# EasyEDA Pro project 水利智能船.epro, board PCB1
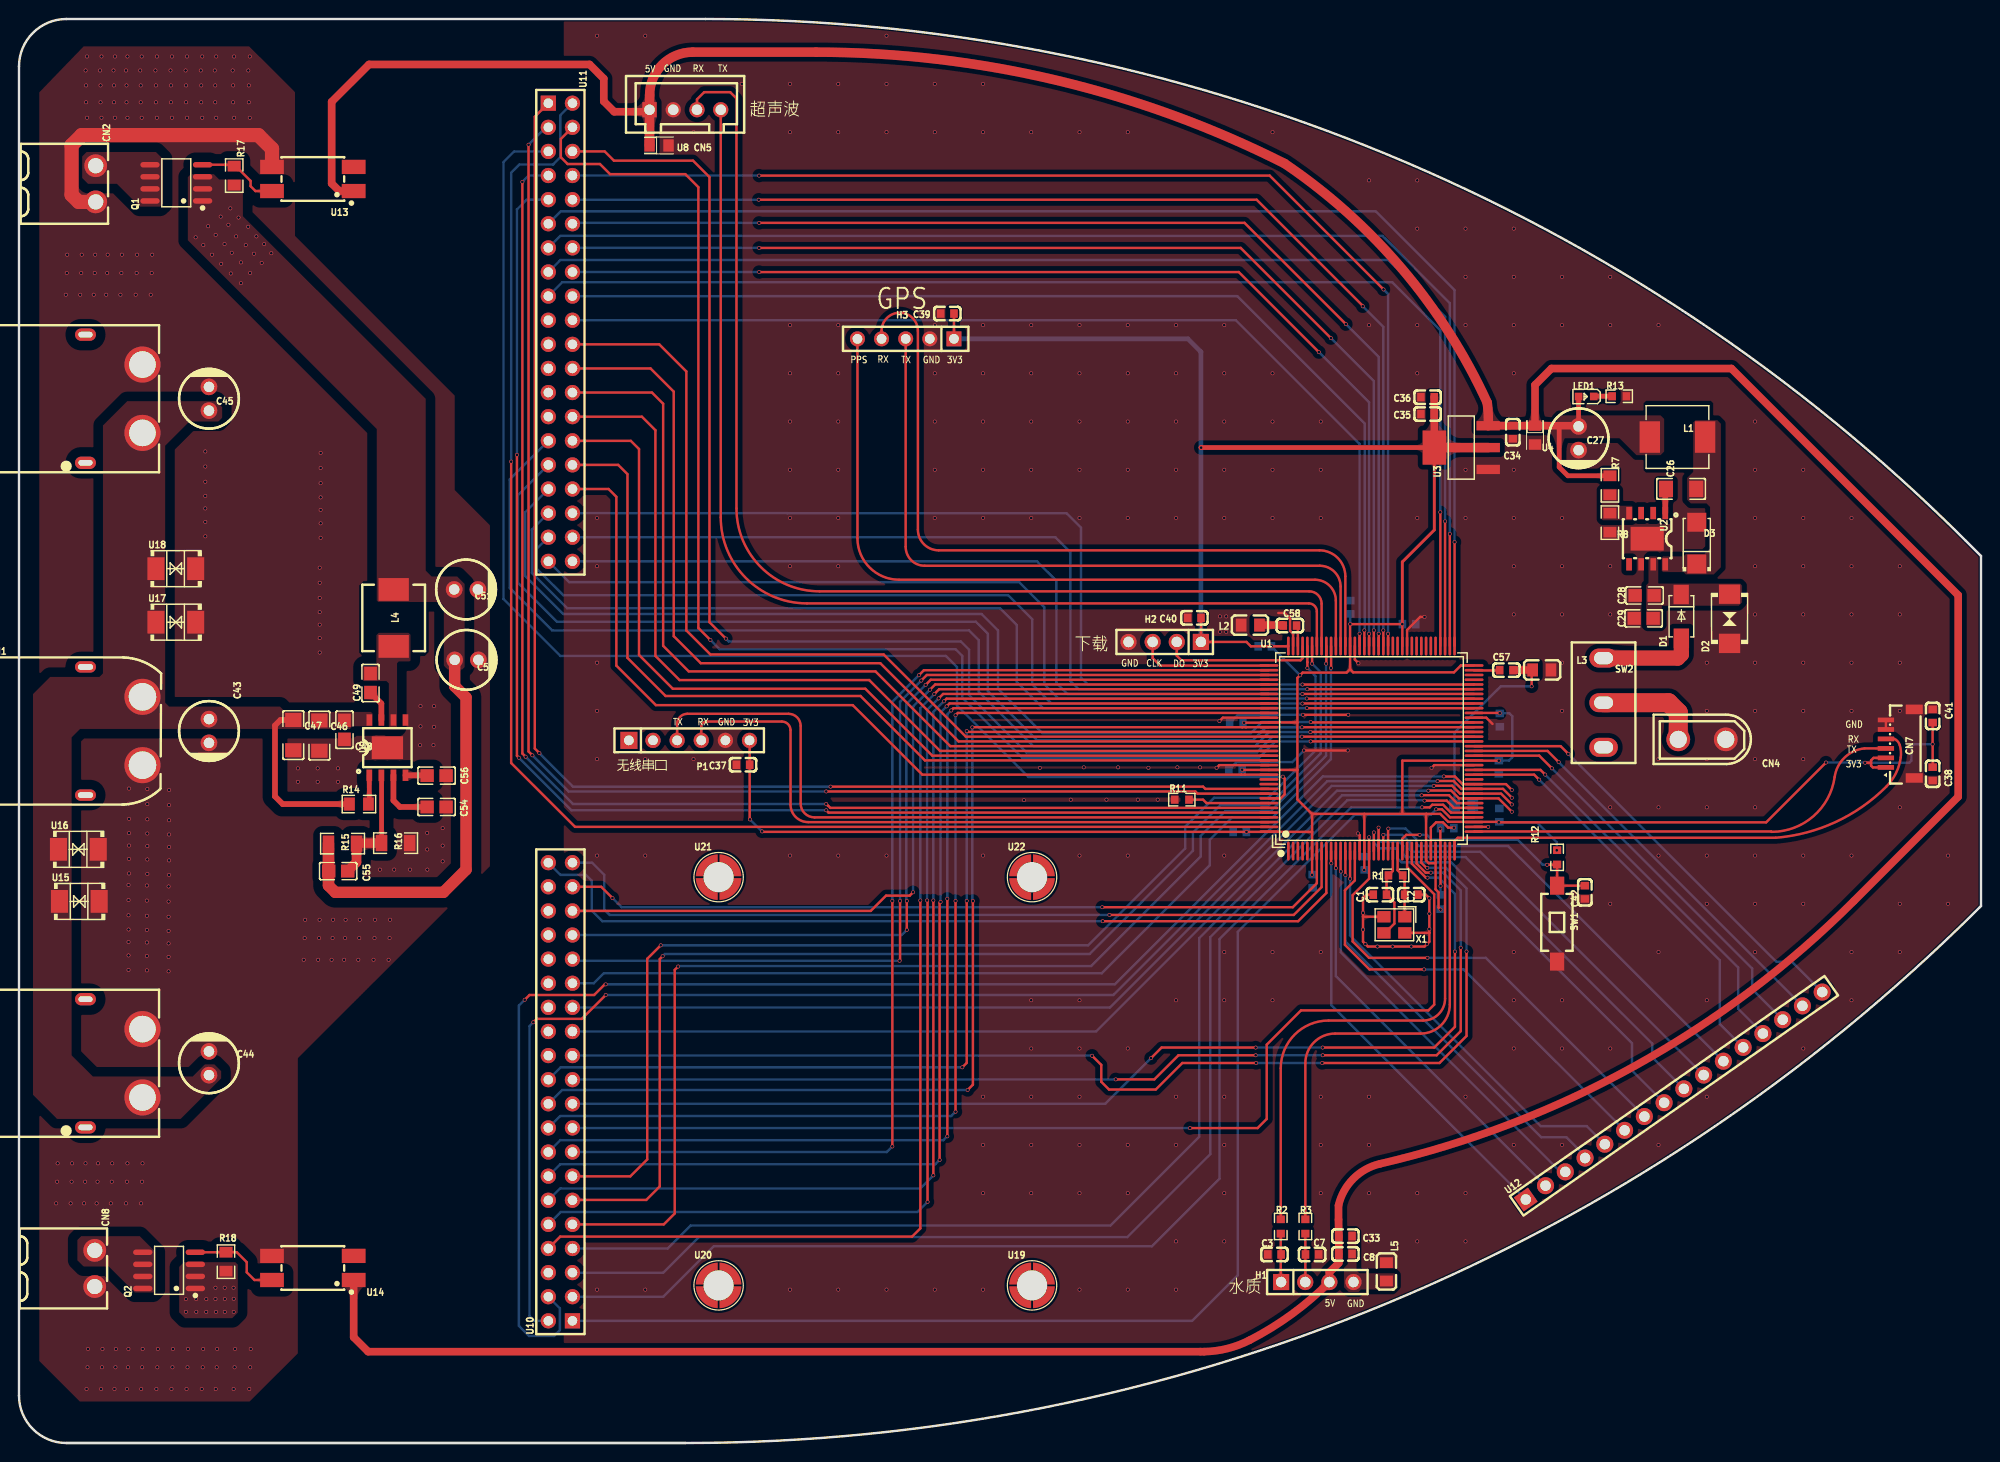
[diagram p1: board, top side]
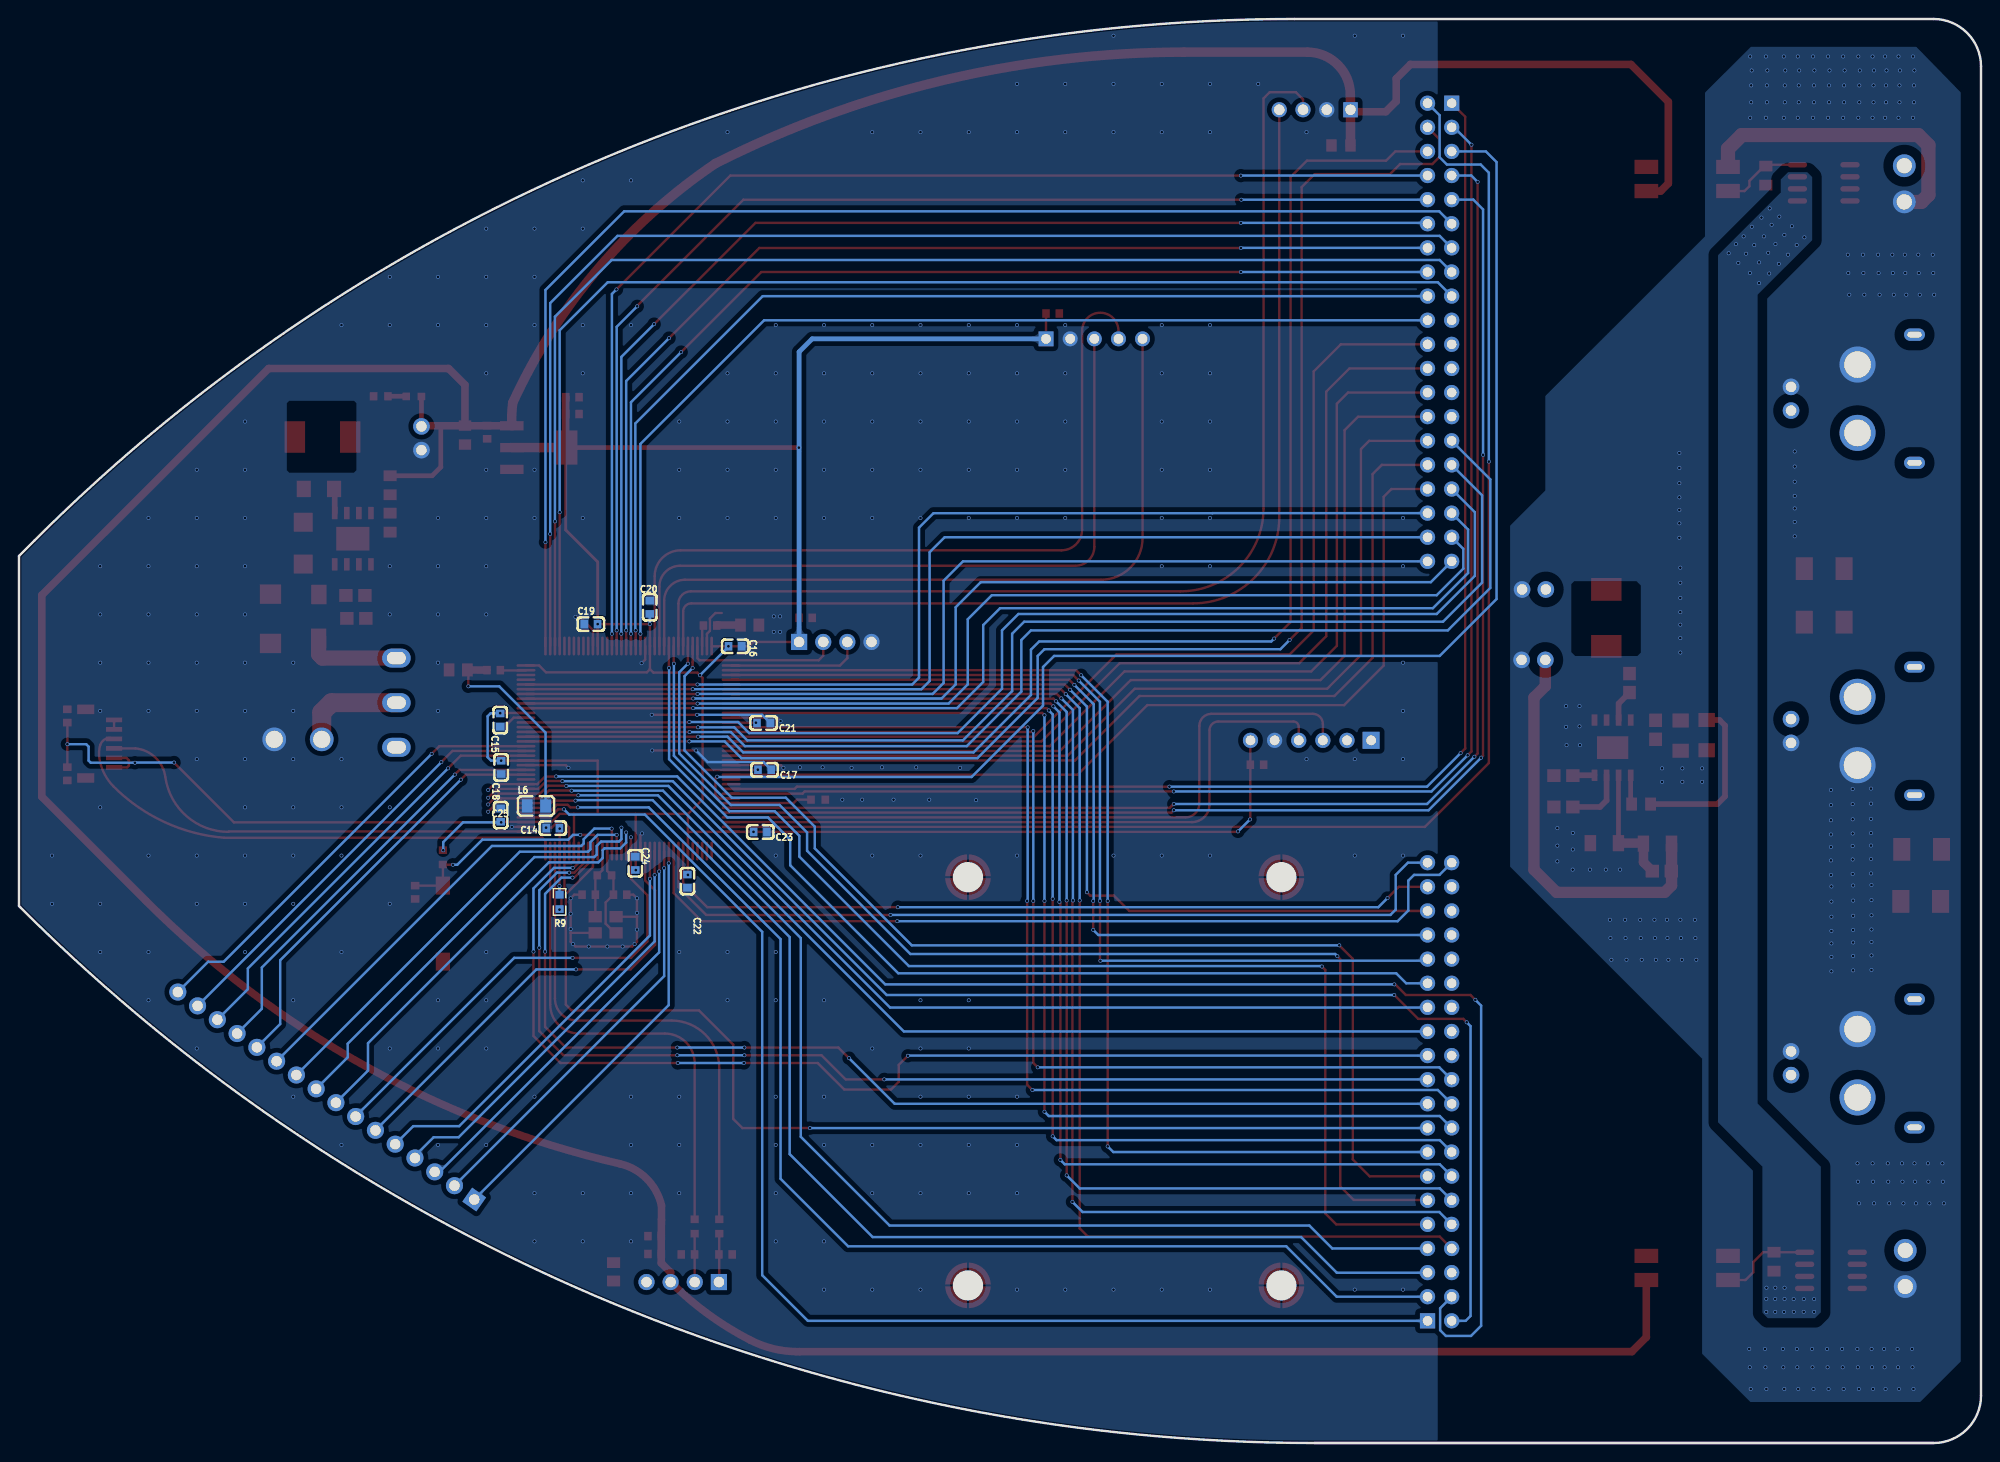
[diagram p2: board, bottom side, seen from below]

Outline 206.57 x 150 mm; copper layers: Top Layer, Bottom Layer. Coordinates in mm from the lower left corner of the outline.
Outline path: 5,0 arc(1.46,1.46) 0,5 0,145 arc(1.46,148.54) 5,150 72.27,150 arc(144.08,135.72) 204.96,95.04 206.57,93.43 206.57,56.57 206.45,56.45 arc(143.92,14.67) 70.16,0 ; 5,0 70.16,0 ; 5,0 70.16,0
Stack: Top Layer 0.035mm / Dielectric1 1.51mm FR4 er 4.5 / Bottom Layer 0.035mm

## Design rules (mm)
template: 自定义配置
spacing copperThickness1oz (default): track to track 0.102, other pairs 0.152 to 0.3
spacing copperThickness2oz: track to track 0.203, other pairs 0.152 to 0.3
track width copperThickness1oz (default): min 0.127, default 0.254, max 2.54
track width copperThickness2oz: min 0.203, default 0.254, max 2.54
differential pair differentialPair (default): width min 0.127, default 0.254, max 2.54; gap min 0.152, default 0.152
via viaSize (default): diameter min 0.3, default 0.4, max 10; hole min 0.3, default 0.3, max 6.3

## Placement (name value [footprint] x y rotation side)
C1  10pF  [C0603]  143.28 57.76 180 top
C2  10pF  [C0603]  146.58 57.76 0 top
C3  100nF  [C0603]  132.18 19.86 180 top
C7  100nF  [C0603]  136.14 19.86 180 top
C8  100nF  [C0603]  139.65 19.91 0 top
C14  100nF  [C0603]  150.37 64.77 180 bottom
C15  100nF  [C0603]  155.91 76.15 90 bottom
C16  100nF  [C0603]  131.17 83.92 0 bottom
C17  100nF  [C0603]  128.07 70.92 0 bottom
C18  100nF  [C0603]  155.8 71.17 90 bottom
C19  100nF  [C0603]  146.35 86.26 180 bottom
C20  100nF  [C0603]  140.16 88.04 270 bottom
C21  100nF  [C0603]  128.17 75.84 0 bottom
C22  100nF  [C0603]  136.19 59.18 90 bottom
C23  100nF  [C0603]  128.52 64.36 0 bottom
C24  100nF  [C0603]  141.68 61.06 90 bottom
C25  100nF  [C0603]  155.85 66.14 90 bottom
C26  10nF  [C1206]  174.99 100.5 0 top
C27  220uF  [CAP-TH_BD6.3-P2.50-D0.6-FD-1]  164.2 105.84 270 top
C28  10uF  [C0805]  171.15 89.28 180 top
C29  4.7uF  [C0805]  171.06 86.87 180 top
C33  10uF  [C0603]  139.65 21.79 0 top
C34  100nF  [C0603]  157.28 106.48 90 top
C35  100nF  [C0603]  148.3 108.38 0 top
C36  10uF  [C0603]  148.3 110.16 0 top
C37  100nF  [C0603]  76.23 71.45 0 top
C38  100nF  [C0603]  201.48 70.49 90 top
C39  100nF  [C0603]  97.74 118.97 180 top
C40  100nF  [C0603]  123.75 86.92 0 top
C41  100nF  [C0603]  201.48 76.59 270 top
C42  100nF  [C0603]  164.86 58.01 90 top
C43  100uF  [CAP-TH_BD6.3-P2.50-D0.6-FD-1]  20 75 270 top
C44  100uF  [CAP-TH_BD6.3-P2.50-D0.6-FD-1]  20 40 90 top
C45  100uF  [CAP-TH_BD6.3-P2.50-D0.6-FD-1]  20 110 90 top
C46  10uF  [C1206]  31.62 74.52 90 top
C47  10uF  [C1206]  28.88 74.57 90 top
C48  100nF  [C0805]  34.27 75.13 90 top
C49  100nF  [C0805]  37.01 80.05 90 top
C51  22uF  [CAP-TH_BD6.3-P2.50-D0.6-FD-1]  47.07 89.91 0 top
C52  22uF  [CAP-TH_BD6.3-P2.50-D0.6-FD-1]  47.12 82.49 0 top
C54  1uF  [C0805]  43.97 67 180 top
C55  100nF  [C0805]  33.61 60.24 0 top
C56  8.2nF  [C0805]  43.97 70.3 180 top
C57  2.2uF  [C0603]  156.59 81.41 0 top
C58  2.2uF  [C0603]  133.81 86.11 180 top
CN1  XT60PW-M  [CONN-TH_XT60PW-M]  10 75 0 top
CN2  3.81-2P  [CONN-TH_2P-P3.81_KF2EDGR-3.81-2P]  8.08 132.64 270 top
CN4  XT30UPB-M  [CONN-TH_XT30UPB-M]  177.2 74.12 180 top
CN5  ZX-XH2.54-4PZZ  [CONN-TH_4P-P2.50_4PIN]  70.13 140.44 0 top
CN7  HC-1.0-6PLT  [CONN-SMD_6P-P1.00_HCTL_HC-1.0-6PLT]  198.05 73.67 90 top
CN8  3.81-2P  [CONN-TH_2P-P3.81_KF2EDGR-3.81-2P]  7.97 18.39 270 top
D1  SS54  [SMA_L4.3-W2.6-LS5.0-FD]  175.01 87.07 90 top
D2  SMBJ28CA  [SMB_L4.3-W3.6-LS5.4-BI]  180.09 86.82 90 top
D3  B340A  [SMA_L4.3-W2.6-LS5.1-RD]  176.64 94.79 90 top
H1  2.54-1*4P母  [HDR-TH_4P-P2.54-V-F]  136.69 16.96 0 top
H2  PZ254V-11-04P  [HDR-TH_4P-P2.54-V-M]  120.62 84.38 180 top
H3  2.54-1*5P母  [HDR-TH_5P-P2.54-V-F]  93.35 116.31 180 top
L1  15uH  [IND-SMD_L7.1-W6.6]  174.61 105.96 180 top
L2  BLM21PG221SN1D  [L0805]  129.64 86.16 0 top
L3  BLM21PG221SN1D  [L0805]  160.32 81.43 180 top
L4  1.5uH  [IND-SMD_L7.0-W6.6]  39.45 86.91 90 top
L5  BLM21PG221SN1D  [L0805]  143.97 18.03 270 top
L6  BLM21PG221SN1D  [L0805]  152.09 67.11 180 bottom
LED1  XL-1608SURC-06  [LED0603-RD_RED]  165 110.24 180 top
P1  2.54-1*6P母  [HDR-TH_6P-P2.54-V-F]  70.56 74.02 0 top
Q1  SI4435DY  [SOP-8_L5.0-W4.0-P1.27-LS6.0-BL]  16.56 132.74 90 top
Q2  SI4435DY  [SOP-8_L5.0-W4.0-P1.27-LS6.0-BL]  15.8 18.19 90 top
R1  1MΩ  [R0603]  144.93 59.79 180 top
R2  10kΩ  [R0603]  132.84 22.81 270 top
R3  10kΩ  [R0603]  135.43 22.81 270 top
R7  10kΩ  [R0805]  167.5 100.88 90 top
R8  3.24kΩ  [R0805]  167.5 96.95 90 top
R9  0Ω  [R0603]  149.66 57 90 bottom
R11  10kΩ  [R0603]  122.43 67.77 180 top
R12  10kΩ  [R0603]  161.94 61.69 90 top
R13  10kΩ  [R0603]  168.48 110.26 180 top
R14  10kΩ  [R0805]  35.79 67.3 0 top
R15  10kΩ  [R1206]  34.06 63.14 0 top
R16  1.5kΩ  [R1206]  39.65 63.19 180 top
R17  10K  [R0805]  22.66 133.5 270 top
R18  10K  [R0805]  21.79 19.1 270 top
SW1  TS-1101-C-W  [SW-SMD_L6.0-W3.3-LS8.0]  161.94 54.71 270 top
SW2  SS-12D10L5  [SW-TH_SS-12D10L5]  166.83 77.98 270 top
U1  STM32F429ZGT6  [LQFP-144_L20.0-W20.0-P0.50-LS22.0-BL]  142.39 73.15 0 top
U2  TPS5430DDAR  [ESOP-8_L4.9-W3.9-P1.27-LS6.0-TL-EP]  171.42 95.26 270 top
U3  AMS1117-3.3V  [SOT-223-4_L6.5-W3.5-P2.30-LS7.0-TR]  151.85 104.85 90 top
U4  10uF  [CAP-SMD_L2.0-W1.3-FD]  159.61 106.17 270 top
U5  XT60PW-F  [TH_2P-XT60PW-F]  10 40 90 top
U7  XT60PW-F  [TH_2P-XT60PW-F]  10 110 90 top
U8  10uF  [CAP-SMD_L2.0-W1.3-FD]  67.39 136.68 0 top
U9  TPS54628DDAR  [ESOP-8_L4.9-W3.9-P1.27-LS6.0-BL-EP]  38.79 73.25 0 top
U10  2.54-2*20  [HDR-TH_40P-P2.54-V-F-R2-C20-S2.54]  57 37 90 top
U11  2.54-2*20  [HDR-TH_40P-P2.54-V-F-R2-C20-S2.54]  57 117 270 top
U12  ZX-PZ2.54-1-16PZZ  [HDR-TH_16P-P2.54-V-M-2]  174.24 36.58 35 top
U13  PC817C  [OPTO-SMD-4_L4.6-W6.5-P2.54-LS10.3-TL]  30.94 133.15 180 top
U14  PC817C  [OPTO-SMD-4_L4.6-W6.5-P2.54-LS10.3-TL]  30.94 18.44 180 top
U15  SMBJ6.5CA  [SMB_L4.6-W3.5-LS5.3-BI]  6.35 57.05 0 top
U16  SMBJ6.5CA  [SMB_L4.6-W3.5-LS5.3-BI]  6.25 62.53 0 top
U17  SMBJ6.5CA  [SMB_L4.6-W3.5-LS5.3-BI]  16.51 86.46 0 top
U18  SMBJ6.5CA  [SMB_L4.6-W3.5-LS5.3-BI]  16.51 92.1 0 top
U19  M3x10+6Cu  [SMD_L4.7-W4.7-D3.0]  106.66 16.6 0 top
U20  M3x10+6Cu  [SMD_L4.7-W4.7-D3.0]  73.66 16.6 0 top
U21  M3x10+6Cu  [SMD_L4.7-W4.7-D3.0]  73.66 59.6 0 top
U22  M3x10+6Cu  [SMD_L4.7-W4.7-D3.0]  106.66 59.6 0 top
X1  32MHz  [CRYSTAL-SMD_4P-L3.2-W2.5-BL]  144.81 54.58 180 top

## Footprints (pads in the part's own frame, mm; a bottom-side part is the same pattern mirrored in y, then rotated)
C0603
  rect 0.8x0.9 smd: 1(-0.7,0) 2(0.7,0)
C0805
  rect 1.41x1.35 smd: 1(-1,0) 2(1,0)
C1206
  rect 1.485x1.728 smd: 1(-1.593,0) 2(1.593,0)
CAP-SMD_L2.0-W1.3-FD
  rect 1.1x1.3 smd: 1(-1,0) 2(1,0)
CAP-TH_BD6.3-P2.50-D0.6-FD-1
  round 1.75 hole 1.1: 1(-1.25,0) 2(1.25,0)
CONN-SMD_6P-P1.00_HCTL_HC-1.0-6PLT
  rect 0.5x1.71 smd: 1(-2.5,1.492) 2(-1.5,1.492) 3(-0.5,1.492) 4(0.5,1.492) 5(1.5,1.492) 6(2.501,1.492)
  rect 1x1.8 smd: 7(3.611,-1.492) 8(-3.611,-1.492)
CONN-TH_2P-P3.81_KF2EDGR-3.81-2P
  round 2.4 hole 1.6: 1(-1.905,0) 2(1.905,0)
CONN-TH_4P-P2.50_4PIN
  rect 1.524x1.6 hole 1.1: 1(-3.75,0)
  round 1.6 hole 1.1: 2(-1.25,0) 3(1.25,0) 4(3.75,0)
CONN-TH_XT30UPB-M
  round 2.5 hole 1.8: 1(-2.5,0) 2(2.5,0)
CONN-TH_XT60PW-M
  round 3.8 hole 2.9: 1(3,-3.6) 2(3,3.6)
  oval 2.2x1.2 hole 1.6x0.6: 3(-3,6.75) 4(-3,-6.75)
CRYSTAL-SMD_4P-L3.2-W2.5-BL
  rect 1.4x1.2 smd: 1(-1.1,-0.85) 2(1.1,-0.85) 3(1.1,0.85) 4(-1.1,0.85)
ESOP-8_L4.9-W3.9-P1.27-LS6.0-BL-EP
  rect 0.6x1.2 smd: 1(-1.905,-2.909) 2(-0.635,-2.909) 3(0.635,-2.909) 4(1.905,-2.909) 5(1.905,2.909) 6(0.635,2.909) 7(-0.635,2.909) 8(-1.905,2.909)
  rect 3.3x2.4 smd: 9(0,0)
ESOP-8_L4.9-W3.9-P1.27-LS6.0-TL-EP
  rect 1.3x0.6 smd: 1(-2.7,1.905) 2(-2.7,0.635) 3(-2.7,-0.635) 4(-2.7,-1.905) 5(2.7,-1.905) 6(2.7,-0.635) 7(2.7,0.635) 8(2.7,1.905)
  rect 2.5x3.5 smd: 9(0,0)
HDR-TH_4P-P2.54-V-F
  rect 1.7x1.7 hole 1.1: 1(-3.81,0)
  round 1.7 hole 1.1: 2(-1.27,0) 3(1.27,0) 4(3.81,0)
HDR-TH_4P-P2.54-V-M
  rect 1.7x1.7 hole 1.1: 1(-3.81,0)
  round 1.7 hole 1.1: 2(-1.27,0) 3(1.27,0) 4(3.81,0)
HDR-TH_5P-P2.54-V-F
  rect 1.575x1.575 hole 1.02: 1(-5.08,0)
  round 1.575 hole 1.02: 2(-2.54,0) 3(0,0) 4(2.54,0) 5(5.08,0)
HDR-TH_6P-P2.54-V-F
  rect 1.8x1.8 hole 1.02: 1(-6.35,0)
  round 1.6 hole 1.02: 2(-3.81,0) 3(-1.27,0) 4(1.27,0) 5(3.81,0) 6(6.35,0)
HDR-TH_16P-P2.54-V-M-2
  rect 1.8x1.8 hole 1.1: 1(-19.05,0)
  round 1.8 hole 1.1: 2(-16.51,0) 3(-13.97,0) 4(-11.43,0) 5(-8.89,0) 6(-6.35,0) 7(-3.81,0) 8(-1.27,0) 9(1.27,0) 10(3.81,0) 11(6.35,0) 12(8.89,0) 13(11.43,0) 14(13.97,0) 15(16.51,0) 16(19.05,0)
HDR-TH_40P-P2.54-V-F-R2-C20-S2.54
  rect 1.6x1.6 hole 1: 1(-24.13,-1.27)
  round 1.6 hole 1: 2(-24.13,1.27) 3(-21.59,-1.27) 4(-21.59,1.27) 5(-19.05,-1.27) 6(-19.05,1.27) 7(-16.51,-1.27) 8(-16.51,1.27) 9(-13.97,-1.27) 10(-13.97,1.27) 11(-11.43,-1.27) 12(-11.43,1.27) 13(-8.89,-1.27) 14(-8.89,1.27) 15(-6.35,-1.27) 16(-6.35,1.27) 17(-3.81,-1.27) 18(-3.81,1.27) 19(-1.27,-1.27) 20(-1.27,1.27) 21(1.27,-1.27) 22(1.27,1.27) 23(3.81,-1.27) 24(3.81,1.27) 25(6.35,-1.27) 26(6.35,1.27) 27(8.89,-1.27) 28(8.89,1.27) 29(11.43,-1.27) 30(11.43,1.27) 31(13.97,-1.27) 32(13.97,1.27) 33(16.51,-1.27) 34(16.51,1.27) 35(19.05,-1.27) 36(19.05,1.27) 37(21.59,-1.27) 38(21.59,1.27) 39(24.13,-1.27) 40(24.13,1.27)
IND-SMD_L7.0-W6.6
  rect 2.4x3.2 smd: 1(-3,0) 2(3,0)
IND-SMD_L7.1-W6.6
  rect 2.15x3.32 smd: 1(-2.913,0) 2(2.913,0)
L0805
  rect 1.133x1.377 smd: 1(-0.966,0) 2(0.966,0)
LED0603-RD_RED
  rect 0.8x0.8 smd: 1(-0.799,-0.004) 2(0.799,0.004)
LQFP-144_L20.0-W20.0-P0.50-LS22.0-BL
  oval 0.28x2 smd: 1(-8.75,-10.8) 2(-8.25,-10.8) 3(-7.75,-10.8) 4(-7.25,-10.8) 5(-6.75,-10.8) 6(-6.25,-10.8) 7(-5.75,-10.8) 8(-5.25,-10.8) 9(-4.75,-10.8) 10(-4.25,-10.8) 11(-3.75,-10.8) 12(-3.25,-10.8) 13(-2.75,-10.8) 14(-2.25,-10.8) 15(-1.75,-10.8) 16(-1.25,-10.8) 17(-0.75,-10.8) 18(-0.25,-10.8) 19(0.25,-10.8) 20(0.75,-10.8) 21(1.25,-10.8) 22(1.75,-10.8) 23(2.25,-10.8) 24(2.75,-10.8) 25(3.25,-10.8) 26(3.75,-10.8) 27(4.25,-10.8) 28(4.75,-10.8) 29(5.25,-10.8) 30(5.75,-10.8) 31(6.25,-10.8) 32(6.75,-10.8) 33(7.25,-10.8) 34(7.75,-10.8) 35(8.25,-10.8) 36(8.75,-10.8) 73(8.75,10.8) 74(8.25,10.8) 75(7.75,10.8) 76(7.25,10.8) 77(6.75,10.8) 78(6.25,10.8) 79(5.75,10.8) 80(5.25,10.8) 81(4.75,10.8) 82(4.25,10.8) 83(3.75,10.8) 84(3.25,10.8) 85(2.75,10.8) 86(2.25,10.8) 87(1.75,10.8) 88(1.25,10.8) 89(0.75,10.8) 90(0.25,10.8) 91(-0.25,10.8) 92(-0.75,10.8) 93(-1.25,10.8) 94(-1.75,10.8) 95(-2.25,10.8) 96(-2.75,10.8) 97(-3.25,10.8) 98(-3.75,10.8) 99(-4.25,10.8) 100(-4.75,10.8) 101(-5.25,10.8) 102(-5.75,10.8) 103(-6.25,10.8) 104(-6.75,10.8) 105(-7.25,10.8) 106(-7.75,10.8) 107(-8.25,10.8) 108(-8.75,10.8)
  oval 2x0.28 smd: 37(10.8,-8.75) 38(10.8,-8.25) 39(10.8,-7.75) 40(10.8,-7.25) 41(10.8,-6.75) 42(10.8,-6.25) 43(10.8,-5.75) 44(10.8,-5.25) 45(10.8,-4.75) 46(10.8,-4.25) 47(10.8,-3.75) 48(10.8,-3.25) 49(10.8,-2.75) 50(10.8,-2.25) 51(10.8,-1.75) 52(10.8,-1.25) 53(10.8,-0.75) 54(10.8,-0.25) 55(10.8,0.25) 56(10.8,0.75) 57(10.8,1.25) 58(10.8,1.75) 59(10.8,2.25) 60(10.8,2.75) 61(10.8,3.25) 62(10.8,3.75) 63(10.8,4.25) 64(10.8,4.75) 65(10.8,5.25) 66(10.8,5.75) 67(10.8,6.25) 68(10.8,6.75) 69(10.8,7.25) 70(10.8,7.75) 71(10.8,8.25) 72(10.8,8.75) 109(-10.8,8.75) 110(-10.8,8.25) 111(-10.8,7.75) 112(-10.8,7.25) 113(-10.8,6.75) 114(-10.8,6.25) 115(-10.8,5.75) 116(-10.8,5.25) 117(-10.8,4.75) 118(-10.8,4.25) 119(-10.8,3.75) 120(-10.8,3.25) 121(-10.8,2.75) 122(-10.8,2.25) 123(-10.8,1.75) 124(-10.8,1.25) 125(-10.8,0.75) 126(-10.8,0.25) 127(-10.8,-0.25) 128(-10.8,-0.75) 129(-10.8,-1.25) 130(-10.8,-1.75) 131(-10.8,-2.25) 132(-10.8,-2.75) 133(-10.8,-3.25) 134(-10.8,-3.75) 135(-10.8,-4.25) 136(-10.8,-4.75) 137(-10.8,-5.25) 138(-10.8,-5.75) 139(-10.8,-6.25) 140(-10.8,-6.75) 141(-10.8,-7.25) 142(-10.8,-7.75) 143(-10.8,-8.25) 144(-10.8,-8.75)
OPTO-SMD-4_L4.6-W6.5-P2.54-LS10.3-TL
  rect 2.5x1.5 smd: 1(-4.3,1.27) 2(-4.3,-1.27) 3(4.3,-1.27) 4(4.3,1.27)
R0603
  rect 0.806x0.864 smd: 1(-0.753,0) 2(0.753,0)
R0805
  rect 1.133x1.377 smd: 1(-1,0) 2(1,0)
R1206
  rect 1.208x1.701 smd: 1(-1.479,0) 2(1.479,0)
SMA_L4.3-W2.6-LS5.0-FD
  rect 2.046x1.62 smd: 1(-2.304,-0.009) 2(2.304,0.009)
SMA_L4.3-W2.6-LS5.1-RD
  rect 2x2 smd: 1(-2.2,0) 2(2.2,0)
SMB_L4.3-W3.6-LS5.4-BI
  rect 2.047x2.241 smd: 1(-2.591,0) 2(2.591,0)
SMB_L4.6-W3.5-LS5.3-BI
  rect 1.8x2.4 smd: 1(-2.091,0) 2(2.091,0)
SMD_L4.7-W4.7-D3.0
  custom 2.3x2.3 smd: 1(-1.25,-1.528) 1(-1.25,1.528) 1(1.25,1.528) 1(1.25,-1.528)
SOP-8_L5.0-W4.0-P1.27-LS6.0-BL
  oval 0.574x2.035 smd: 1(-1.905,-2.768) 2(-0.635,-2.768) 3(0.635,-2.768) 4(1.905,-2.768) 5(1.905,2.768) 6(0.635,2.768) 7(-0.635,2.768) 8(-1.905,2.768)
SOT-223-4_L6.5-W3.5-P2.30-LS7.0-TR
  rect 0.98x2.47 smd: 1(-2.3,-2.835) 2(0,-2.835) 3(2.3,-2.835)
  rect 3.6x2.47 smd: 4(0,2.835)
SW-SMD_L6.0-W3.3-LS8.0
  rect 1.9x1.5 smd: 1(-4,0) 2(4,0)
SW-TH_SS-12D10L5
  oval 2x3 hole 1.3x2: 1(-4.7,0) 2(0,0) 3(4.7,0)
TH_2P-XT60PW-F
  oval 1.3x2.2 hole 0.6x1.5: 1(-6.75,3) 2(6.75,3)
  round 3.8 hole 2.8: 3(-3.6,-3) 4(3.6,-3)

## Nets
As in the schematic.

Pads without a net: CN1 3 4; P1 1 2; SW2 3; U1 48 133 134; U2 2 3 5; U5 1 2; U7 1 2; U10 24 26 28 30 32 34 36; U19 1; U20 1; U21 1; U22 1

## Via types
v1: diameter 0.4, hole 0.3, Top Layer to Bottom Layer, 719 vias
v2: diameter 0.5, hole 0.3, Top Layer to Bottom Layer, 1 via

## Routing (per net, layer and track width the routed paths; a pad name or vN(x,y) marks a point on that pad's centre or on a via; arc(x,y) is an arc through that point)
3V3: length 396.8
  Top Layer w0.254: 140.14,81.52 139.77,81.15 135.15,81.15 v1(134.87,80.87) 134.59,80.59 134.59,75.89 ; 140.14,81.52 U1.95 140.14,86.26 v1(145.64,86.26) 145.64,83.93 ; 140.14,81.52 140.14,81.5 140.46,81.18 151.08,81.18 151.8,81.9 U1.72 ; 149.14,61.07 148.43,61.07 148.14,61.36 U1.30 148.14,66.25 148.17,66.27 ; 149.14,61.07 149.14,58.33 149.45,58.01 149.45,56.39 v1(149.66,56.19) ; 149.14,61.07 149.14,62.33 ; 134.59,75.89 134.58,75.9 U1.121 ; 134.59,75.89 134.59,70.91 ; v1(155.91,76.88) 155.88,76.9 U1.62 ; 196.56,72.17 195.25,72.17 195,71.91 195,71.66 ; 148.17,66.27 149.63,66.27 150.47,65.43 155.75,65.43 v1(155.8,65.38) 183.94,65.38 v1(190.25,71.68) ; 148.17,66.27 145.64,66.27 ; 136.14,66.27 136.14,64.39 ; 136.14,66.27 141.64,66.27 ; 136.14,66.27 136.12,66.27 134.59,67.79 134.59,70.91 ; 136.14,64.39 136.13,64.38 v1(129.24,64.38) 78.28,64.38 v1(78.23,64.42) ; 136.14,64.39 U1.6 v1(136.14,59.84) ; 195,71.66 v1(194.36,71.66) ; 195,71.66 195,71.35 195.18,71.17 196.56,71.17 ; 145.64,66.27 145.64,71.88 v1(155.8,71.88) ; 145.64,66.27 141.64,66.27 ; 131.59,75.88 v1(128.98,75.88) ; 134.59,70.91 134.59,70.9 U1.131 128.8,70.9 v1(128.78,70.93) ; C40.2 124.45,84.39 H2.1 129.23,84.38 129.69,83.92 v1(131.88,83.92) 133.64,83.92 133.64,83.93 ; C41.2 201.47,75.88 v1(201.47,73.61) 201.48,73.6 C38.2 ; C39.1 98.44,116.31 H3.1 ; 141.64,66.27 U1.17 141.64,60.36 v1(141.63,60.35) ; 76.96,74.04 76.93,74.01 C37.2 76.93,65.72 v1(76.96,65.68)
  Top Layer w0.3: v1(145.64,86.26) 145.64,92.81 149.01,96.18 U3.4
  Top Layer w0.5: U3.4 124.46,104.85 v2(124.46,104.85)
  Top Layer w0.8: U3.4 149.01,110.15 C36.2
  Top Layer w1: U3.2 U3.4
  Bottom Layer w0.254: v1(161.9,62.43) 161.9,63.3 159.82,65.38 v1(155.8,65.38) ; v1(134.87,80.87) 131.88,83.87 v1(131.88,83.92) ; v1(155.91,76.88) 156.91,76.88 157.23,76.56 157.23,72.24 156.87,71.88 155.81,71.88 v1(155.8,71.88) ; v1(78.23,64.42) 78.22,64.42 v1(76.96,65.68) ; v1(190.25,71.68) 194.34,71.68 v1(194.36,71.66) 199.01,71.66 199.24,71.88 199.24,73.36 199.49,73.61 v1(201.47,73.61) ; v1(140.16,86.26) C20.2
  Bottom Layer w0.5: H2.1 124.43,114.94 123.06,116.31 H3.1
+5V: length 465.8
  Top Layer w0.5: C27.1 164.2,110.35 ; 162.16,107.09 162.16,102.79 163.07,101.88 R7.2
  Top Layer w0.8: U14.1 35.24,11.14 36.76,9.62 124.38,9.62 arc(124.58,9.62) 124.78,9.62 arc(127.23,9.95) 129.54,10.82 arc(133.99,13.56) H1.3 137.96,17.97 138.95,18.96 C8.1 C33.1 arc(138.93,22.65) 138.92,23.52 138.92,25.02 arc(140.49,27.85) 143.31,29.41 arc(170.19,39.76) 193.19,57.1 204.16,68.07 204.16,89.31 180.29,113.18 161.34,113.18 159.61,111.45 U4.1 ; CN5.1 66.17,140.23 62.66,140.23 61.57,141.33 61.57,143.71 60.07,145.21 36.85,145.21 32.92,141.28 32.92,132.68 33.72,131.88 U13.1 ; U3.3 164.13,107.15 C27.1
  Top Layer w1: U8.1 66.38,136.68 CN5.1 66.4,141.99 arc(67.72,145.18) 70.92,146.51 83.92,146.51 arc(109.27,143.53) 133.25,134.77 arc(145.65,123.64) 154.58,109.58 arc(154.69,108.37) U3.3
AGND: length 29.6
  Top Layer w0.254: v1(151.08,64.82) 150.47,64.82 149.91,65.38 149.2,65.38 148.64,64.82 148.64,62.33 ; L3.2 159.26,81.33 v1(159.26,79.7)
  Top Layer w0.8: L2.2 133.06,86.16 C58.2 ; C57.2 arc(158.33,81.42) L3.2
  Bottom Layer w0.254: L6.2 151.13,74.83 156.01,79.7 v1(159.26,79.7)
GND: length 82.9
  Top Layer w0.254: U1.16 141.14,64.04 v1(140.97,64.21) ; 148.49,53.74 v1(148.49,54.14) v1(148.49,55.76) v1(148.49,57.38) 148.11,57.76 C2.2 ; 148.49,53.74 148.49,52.81 v1(148.24,52.56) 147.98,52.3 v1(146.59,52.3) v1(144.62,52.3) v1(143.02,52.3) 142.01,52.3 v1(141.76,52.55) 141.5,52.81 v1(141.5,54.08) 141.5,55.43 ; 148.49,53.74 148.48,53.73 X1.4 ; X1.2 141.51,55.43 141.5,55.43 ; v1(135.18,76.71) v1(139.95,76.71) ; 155.14,75.74 154.48,76.4 U1.61 ; U1.94 140.64,82.52 v1(141.02,82.14) ; C1.2 141.88,57.76 v1(141.5,57.38) v1(141.5,55.84) 141.5,55.43 ; U1.120 126.74,76.4 v1(126.39,76.05) ; U1.38 v1(154.69,64.9) ; v1(126.09,71.12) 126.37,71.4 128.57,71.4 128.58,71.41 128.98,71.41 128.98,71.4 U1.130 ; v1(148.72,71.12) 149,71.4 U1.51 ; U1.107 134.14,85.23 133.83,85.54 133.83,86.85 133.25,87.43 132.59,87.43 ; CN7.5 CN7.6 ; v1(135.28,72.95) v1(139.9,72.95) ; v1(147.98,87.02) 147.52,87.02 146.14,85.64 U1.83
  Bottom Layer w0.254: v1(135.28,72.95) 134.06,71.73 128.18,71.73 C17.1 ; v1(135.18,76.71) 128.33,76.71 C21.1
  vias: v1(60.86,148.24) v1(60.86,97.44) v1(60.86,92.36) v1(60.86,82.2) v1(60.86,77.12) v1(60.86,72.04) v1(60.86,61.88) v1(60.86,16.16) v1(65.94,148.24) v1(65.94,72.04) v1(65.94,61.88) v1(65.94,16.16) v1(71.02,138.08) v1(71.02,72.04) v1(76.09,143.16) v1(81.18,143.16) v1(81.18,138.08) v1(81.18,117.76) v1(81.18,112.68) v1(81.18,107.6) v1(81.18,102.52) v1(81.18,97.44) v1(81.18,92.36) v1(81.18,61.88) v1(81.18,16.16) v1(86.25,143.16) v1(86.25,138.08) v1(86.25,117.76) v1(86.25,112.68) v1(86.25,107.6) v1(86.25,102.52) v1(86.25,97.44) v1(86.25,92.36) v1(86.25,61.88) v1(86.25,16.16) v1(91.34,148.24) v1(91.34,143.16) v1(91.34,138.08) v1(91.34,61.88) v1(91.34,16.16) v1(96.41,143.16) v1(96.41,138.08) v1(96.41,117.76) v1(96.41,112.68) v1(96.41,107.6) v1(96.41,102.52) v1(96.41,97.44) v1(96.41,16.16) v1(101.5,143.16) v1(101.5,138.08) v1(101.5,117.76) v1(101.5,112.68) v1(101.5,107.6) v1(101.5,102.52) v1(101.5,97.44) v1(101.5,61.88) v1(101.5,36.48) v1(101.5,31.4) v1(101.5,26.32) v1(101.5,16.16) v1(105.81,67.72) v1(106.57,138.08) v1(106.57,117.76) v1(106.57,112.68) v1(106.57,107.6) v1(106.57,102.52) v1(106.57,97.44) v1(106.57,46.64) v1(106.57,41.56) v1(106.57,36.48) v1(106.57,31.4) v1(106.57,26.32) v1(107.48,71.12) v1(110.73,67.77) v1(111.66,138.08) v1(111.66,117.76) v1(111.66,112.68) v1(111.66,107.6) v1(111.66,102.52) v1(111.66,97.44) v1(111.66,61.88) v1(111.66,46.64) v1(111.66,41.56) v1(111.66,36.48) v1(111.66,31.4) v1(111.66,26.32) v1(111.66,16.16) v1(112.11,71.17) v1(114.49,67.77) v1(115.71,71.17) v1(116.74,138.08) v1(116.74,117.76) v1(116.74,112.68) v1(116.74,107.6) v1(116.74,102.52) v1(116.74,97.44) v1(116.74,61.88) v1(116.74,41.56) v1(116.74,31.4) v1(116.74,26.32) v1(116.74,16.16) v1(117.8,67.77) v1(118.91,71.12) v1(119.89,67.77) v1(121.81,117.76) v1(121.81,112.68) v1(121.81,107.6) v1(121.81,102.52) v1(121.81,97.44) v1(121.81,46.64) v1(121.81,36.48) v1(121.81,31.4) v1(121.81,21.24) v1(121.81,16.16) v1(121.96,71.17) v1(124.35,71.17) v1(126.44,87.07) v1(126.44,85.45) v1(126.9,117.76) v1(126.9,112.68) v1(126.9,107.6) v1(126.9,102.52) v1(126.9,97.44) v1(126.9,61.88) v1(126.9,51.72) v1(126.9,46.64) v1(126.9,36.48) v1(126.9,31.4) v1(126.9,26.32) v1(126.9,21.24) v1(127.1,87.07) v1(127.1,85.45) v1(131.97,138.08) v1(131.97,112.68) v1(131.97,107.6) v1(131.97,102.52) v1(131.97,97.44) v1(131.97,51.72) v1(131.97,46.64) v1(137.06,107.6) v1(137.06,102.52) v1(137.06,97.44) v1(137.06,51.72) v1(137.06,36.48) v1(137.06,31.4) v1(137.06,26.32) v1(142.13,133) v1(142.13,117.76) v1(142.13,36.48) v1(142.13,31.4) v1(142.13,26.32) v1(142.13,21.24) v1(147.22,133) v1(147.22,127.92) v1(147.22,117.76) v1(147.22,112.68) v1(147.22,97.44) v1(147.22,26.32) v1(147.22,21.24) v1(152.29,127.92) v1(152.29,122.84) v1(152.29,117.76) v1(152.29,102.52) v1(152.29,97.44) v1(152.29,36.48) v1(152.29,26.32) v1(152.29,21.24) v1(157.38,127.92) v1(157.38,122.84) v1(157.38,117.76) v1(157.38,112.68) v1(157.38,102.52) v1(157.38,97.44) v1(157.38,92.36) v1(157.38,87.28) v1(157.38,51.72) v1(157.38,46.64) v1(157.38,41.56) v1(157.38,31.4) v1(162.46,122.84) v1(162.46,117.76) v1(162.46,97.44) v1(162.46,92.36) v1(162.46,87.28) v1(162.46,82.2) v1(162.46,77.12) v1(162.46,46.64) v1(162.46,41.56) v1(162.46,31.4) v1(167.53,122.84) v1(167.53,117.76) v1(167.53,92.36) v1(167.53,87.28) v1(167.53,66.96) v1(167.53,56.8) v1(167.53,41.56) v1(172.62,117.76) v1(172.62,72.04) v1(172.62,66.96) v1(172.62,61.88) v1(172.62,51.72) v1(172.62,31.4) v1(177.69,82.2) v1(177.69,77.12) v1(177.69,72.04) v1(177.69,66.96) v1(177.69,61.88) v1(177.69,56.8) v1(177.69,46.64) v1(177.69,36.48) v1(182.78,107.6) v1(182.78,102.52) v1(182.78,97.44) v1(182.78,92.36) v1(182.78,87.28) v1(182.78,82.2) v1(182.78,77.12) v1(182.78,72.04) v1(182.78,66.96) v1(182.78,61.88) v1(182.78,56.8) v1(182.78,51.72) v1(187.85,102.52) v1(187.85,97.44) v1(187.85,92.36) v1(187.85,87.28) v1(187.85,82.2) v1(187.85,77.12) v1(187.85,72.04) v1(187.85,61.88) v1(187.85,56.8) v1(187.85,41.56) v1(192.94,97.44) v1(192.94,92.36) v1(192.94,87.28) v1(192.94,82.2) v1(192.94,77.12) v1(192.94,61.88) v1(192.94,51.72) v1(192.94,46.64) v1(198.01,92.36) v1(198.01,87.28) v1(198.01,82.2) v1(198.01,77.12) v1(198.01,66.96) v1(198.01,56.8) v1(198.01,51.72) v1(203.09,61.88) v1(203.09,56.8)
VDDA: length 7
  Top Layer w0.254: v1(149.64,64.72) 149.64,62.33 149.66,62.31 v1(149.66,58.68)
  Bottom Layer w0.254: v1(149.66,58.68) 149.66,57.76 R9.2
AD1_CH1: length 52.9
  Top Layer w0.254: R2.1 132.84,39.47 arc(134.31,43.03) 137.87,44.5 147.83,44.5 arc(149.46,45.18) 150.14,46.81 U1.34
AD1_CH2: length 51.3
  Top Layer w0.254: R3.1 135.43,40 arc(136.35,42.21) 138.56,43.13 147.57,43.13 arc(149.74,44.03) 150.64,46.2 U1.35
BAT_GND: length 32.1
  Top Layer w1.5: U13.3 26.64,136.33 25.2,137.77 6.6,137.77 5.54,136.7 5.54,131.47 6.27,130.73 CN2.2
  vias: v1(3.91,25.24) v1(4.01,27.53) v1(4.06,29.46) v1(4.93,120.95) v1(5.03,123.24) v1(5.08,125.17) v1(5.44,25.24) v1(5.54,27.53) v1(5.59,29.46) v1(6.45,120.95) v1(6.6,125.17) v1(6.55,123.24) v1(6.85,25.24) v1(7.01,144.58) v1(7,29.46) v1(6.95,27.53) v1(7.06,143) v1(7.06,141.22) v1(7.11,5.69) v1(7.16,146.05) v1(7.16,139.6) v1(7.21,7.98) v1(7.26,9.91) v1(7.87,120.95) v1(8.02,125.17) v1(7.97,123.24) v1(8.17,25.24) v1(8.32,29.46) v1(8.27,27.53) v1(8.53,144.58) v1(8.59,143) v1(8.59,141.22) v1(8.64,5.69) v1(8.69,146.05) v1(8.69,139.6) v1(8.74,7.98) v1(8.79,9.91) v1(9.18,120.95) v1(9.34,125.17) v1(9.29,123.24) v1(9.66,25.24) v1(9.82,29.46) v1(9.77,27.53) v1(9.95,144.58) v1(10,143) v1(10,141.22) v1(10.1,146.05) v1(10.1,139.6) v1(10.05,5.69) v1(10.2,9.91) v1(10.15,7.98) v1(10.68,120.95) v1(10.83,125.17) v1(10.78,123.24) v1(11.27,144.58) v1(11.32,143) v1(11.32,141.22) v1(11.27,25.24) v1(11.42,146.05) v1(11.42,139.6) v1(11.42,29.46) v1(11.37,27.53) v1(11.37,5.69) v1(11.53,58.78) v1(11.53,57.19) v1(11.53,55.59) v1(11.53,54.09) v1(11.53,52.78) v1(11.53,51.36) v1(11.53,49.84) v1(11.52,9.91) v1(11.47,7.98) v1(11.58,68.94) v1(11.58,67.35) v1(11.58,65.75) v1(11.58,64.25) v1(11.58,62.94) v1(11.58,61.52) v1(11.58,60) v1(12.28,120.95) v1(12.43,125.17) v1(12.38,123.24) v1(12.76,144.58) v1(12.81,143) v1(12.81,141.22) v1(12.92,146.05) v1(12.92,139.6) v1(12.85,25.24) v1(12.87,5.69) v1(13.01,29.46) v1(12.95,27.53) v1(13.02,9.91) v1(12.97,7.98) v1(13.51,68.89) v1(13.51,67.3) v1(13.51,65.7) v1(13.51,64.2) v1(13.51,62.88) v1(13.51,61.47) v1(13.51,59.94) v1(13.46,58.72) v1(13.46,57.14) v1(13.46,55.54) v1(13.46,54.04) v1(13.46,52.72) v1(13.46,51.31) v1(13.46,49.78) v1(13.87,120.95) v1(14.02,125.17) v1(13.97,123.24) v1(14.36,144.58) v1(14.41,143) v1(14.41,141.22) v1(14.52,146.05) v1(14.52,139.6) v1(14.47,5.69) v1(14.62,9.91) v1(14.57,7.98) v1(15.75,58.62) v1(15.75,57.04) v1(15.75,55.44) v1(15.75,53.94) v1(15.75,52.62) v1(15.75,51.21) v1(15.75,49.68) v1(15.8,68.78) v1(15.8,67.2) v1(15.8,65.6) v1(15.8,64.1) v1(15.8,62.78) v1(15.8,61.37) v1(15.8,59.84) v1(15.95,144.58) v1(16,143) v1(16,141.22) v1(16.1,146.05) v1(16.1,139.6) v1(16.05,5.69) v1(16.2,9.91) v1(16.15,7.98) v1(17.54,144.58) v1(17.59,143) v1(17.59,141.22) v1(17.64,5.69) v1(17.69,146.05) v1(17.69,139.6) v1(17.74,7.98) v1(17.79,9.91) v1(19.14,144.58) v1(19.19,143) v1(19.19,141.22) v1(19.24,5.69) v1(19.29,146.05) v1(19.29,139.6) v1(19.34,7.98) v1(19.39,9.91) v1(19.61,104.44) v1(19.61,102.86) v1(19.61,101.26) v1(19.61,99.76) v1(19.61,98.44) v1(19.61,97.03) v1(19.61,95.5) v1(20.61,144.58) v1(20.66,143) v1(20.66,141.22) v1(20.71,5.69) v1(20.76,146.05) v1(20.76,139.6) v1(20.81,7.98) v1(20.86,9.91) v1(22.49,144.58) v1(22.54,143) v1(22.54,141.22) v1(22.65,146.05) v1(22.65,139.6) v1(22.6,5.69) v1(22.75,9.91) v1(22.7,7.98) v1(24.15,144.58) v1(24.2,143) v1(24.2,141.22) v1(24.25,5.69) v1(24.3,146.05) v1(24.3,139.6) v1(24.35,7.98) v1(24.4,9.91) v1(29.36,71.06) v1(29.36,69.65) v1(29.97,50.9) v1(30.12,55.12) v1(30.07,53.19) v1(31.44,71.06) v1(31.44,69.65) v1(31.5,50.9) v1(31.65,55.12) v1(31.6,53.19) v1(31.66,92.2) v1(31.66,90.62) v1(31.66,89.02) v1(31.66,87.52) v1(31.66,86.2) v1(31.66,84.79) v1(31.66,83.26) v1(31.76,104.29) v1(31.76,102.7) v1(31.76,101.11) v1(31.76,99.61) v1(31.76,98.29) v1(31.76,96.88) v1(31.76,95.35) v1(32.91,50.9) v1(33.01,53.19) v1(33.06,55.12) v1(33.58,71.06) v1(33.58,69.65) v1(34.23,50.9) v1(34.33,53.19) v1(34.38,55.12) v1(35.73,50.9) v1(35.83,53.19) v1(35.88,55.12) v1(37.33,50.9) v1(37.43,53.19) v1(37.48,55.12) v1(38,60.4) v1(38.91,50.9) v1(39.01,53.19) v1(39.06,55.12) v1(39.5,60.4) v1(41.17,60.4) v1(42.22,73.51) v1(42.27,77.62) v1(42.27,75.49) v1(42.98,64.26) v1(42.98,62.52) v1(42.99,60.4) v1(43.64,73.51) v1(43.69,77.62) v1(43.69,75.44) v1(44.6,64.77) v1(44.6,62.93) v1(44.6,61.27)
BAT_IN+: length 17.8
  Top Layer w0.6: C47.2 27.53,76.16 26.95,75.58 26.95,68.11 27.76,67.3 R14.1
GPS_PPS: length 79.9
  Top Layer w0.254: 138.64,83.93 138.64,88.74 arc(138,90.29) 136.45,90.93 92.66,90.93 arc(89.56,92.22) 88.27,95.32 H3.5
PA4: length 138.8
  Top Layer w0.254: U1.40 150.66,65.9 149.81,66.75 v1(149.2,66.75)
  Bottom Layer w0.254: v1(149.2,66.75) 148.64,66.19 140.66,66.19 128.32,53.85 128.32,17.68 123.51,12.87 U10.1
PA5: length 131.5
  Top Layer w0.254: v1(147.73,66.95) 148.52,66.95 148.8,67.23 149.94,67.23 150.77,66.4 U1.41
  Bottom Layer w0.254: v1(147.73,66.95) 140.26,66.95 126.39,53.09 126.39,27.84 119.28,20.73 73.15,20.73 67.84,15.41 U10.3
PA6: length 129.3
  Top Layer w0.254: U1.42 151.08,66.9 150.32,67.67 v1(147.98,67.67)
  Bottom Layer w0.254: v1(147.98,67.67) 147.93,67.72 139.85,67.72 125.43,53.29 125.43,30.43 116.69,21.69 71.58,21.69 67.82,17.93 58.29,17.93 U10.5
PA7: length 127.3
  Top Layer w0.254: U1.43 151.39,67.4 150.56,68.24 147.69,68.24 v1(147.68,68.22)
  Bottom Layer w0.254: U10.7 68.29,20.49 70.71,22.91 114.91,22.91 124.26,32.26 124.26,53.19 139.29,68.22 v1(147.68,68.22)
PA8: length 127.7
  Top Layer w0.254: U1.100 137.64,82.12 v1(137.62,82.09) ; v1(69.39,50.19) 69.04,49.84 69.04,24.18 67.89,23.03 U10.9
  Bottom Layer w0.254: v1(137.62,82.09) 137.62,72.39 131.78,66.55 127,66.55 124.41,63.96 124.41,61.77 112.88,50.24 69.44,50.24 v1(69.39,50.19)
PA11: length 125.1
  Top Layer w0.254: U1.103 v1(136.14,82.09) ; U10.11 58.3,25.6 66.04,25.6 67.46,27.03 67.46,50.97 v1(67.77,51.28)
  Bottom Layer w0.254: v1(136.14,82.09) 137.06,81.18 137.06,72.64 131.62,67.21 126.49,67.21 123.6,64.31 123.6,62.38 112.72,51.51 68,51.51 v1(67.77,51.28)
PA12: length 121.9
  Top Layer w0.254: U1.104 135.64,82.25 135.64,82.25 v1(135.64,81.63) ; v1(67.56,52.43) 66.14,51 66.14,29.87 64.36,28.09 58.29,28.09 U10.13
  Bottom Layer w0.254: v1(67.56,52.43) 112.57,52.43 122.78,62.64 122.78,64.92 125.83,67.97 131.52,67.97 136.5,72.95 136.5,80.78 v1(135.64,81.63)
PA15(JTDI): length 121.8
  Top Layer w0.254: v1(94.74,80.87) 95.27,81.4 U1.110 ; v1(91.95,57.1) v1(91.95,31.24)
  Bottom Layer w0.254: v1(91.95,31.24) 91.36,30.65 U10.15 ; v1(94.74,80.87) 91.95,78.08 v1(91.95,57.1)
PB0: length 147.6
  Top Layer w0.254: v1(61.77,47.19) 59.26,44.68 54.51,44.68 v1(54.15,44.32) ; v1(149.35,69.72) 149.37,69.74 151.04,69.74 151.87,68.9 U1.46 156.24,68.9 v1(157.18,67.97)
  Bottom Layer w0.254: U10.2 54.25,12.87 53.75,13.38 53.75,43.91 v1(54.15,44.32) ; v1(149.35,69.72) 137.74,69.72 115.21,47.19 v1(61.77,47.19)
PB1: length 157.9
  Top Layer w0.254: v1(157.18,68.78) 156.56,69.4 U1.47 151.98,69.4 151.18,70.21 150.02,70.21 v1(150.01,70.21) ; v1(53.24,46.69) 53.75,47.19 60.55,47.19 61.67,48.31 v1(61.77,48.31)
  Bottom Layer w0.254: v1(61.77,48.31) 115.37,48.31 137.27,70.21 v1(150.01,70.21) ; v1(53.24,46.69) 52.63,46.08 52.63,12.34 53.7,11.28 56.34,11.28 56.95,11.89 56.95,14.19 U10.4
PB5: length 147.6
  Top Layer w0.254: U1.135 124.9,68.9 124.66,69.14 v1(85.45,69.14) ; U11.1 54.31,139.7 54.31,73.15 v1(54.79,72.67)
  Bottom Layer w0.254: v1(54.79,72.67) 58.32,69.14 v1(85.45,69.14)
PB6: length 146.5
  Top Layer w0.254: v1(53.65,136.75) 53.65,72.84 v1(54.05,72.44) ; v1(84.99,68.63) 123.85,68.63 124.08,68.4 U1.136
  Bottom Layer w0.254: U11.3 55.48,138.59 v1(53.65,136.75) ; v1(54.05,72.44) 57.86,68.63 v1(84.99,68.63)
PB7: length 147.2
  Top Layer w0.254: U1.137 132.82,67.9 133.25,68.33 133.25,70 v1(133.06,70.19)
  Bottom Layer w0.254: U11.5 52.13,136.05 51,134.93 51,88.9 57,82.91 97.59,82.91 98.75,81.74 98.75,77.67 106.27,70.16 133.03,70.16 v1(133.06,70.19)
PB8: length 144.2
  Top Layer w0.254: v1(53,132.84) 53,72.63 v1(53.34,72.29) ; U1.139 85.41,66.9 85.19,67.13 85.17,67.13 v1(84.99,67.31)
  Bottom Layer w0.254: v1(53,132.84) 53.67,133.51 U11.7 ; v1(84.99,67.31) 58.32,67.31 v1(53.34,72.29)
PB9: length 142.9
  Top Layer w0.254: v1(84.99,66.65) 85.24,66.4 U1.140 ; v1(52.63,72.19) 52.43,72.39 v1(52.43,104.09)
  Bottom Layer w0.254: U11.9 53.45,130.97 52.43,129.95 v1(52.43,104.09) ; v1(52.63,72.19) 58.17,66.65 v1(84.99,66.65)
PB12: length 136.9
  Top Layer w0.254: v1(151.14,94.89) U1.73
  Bottom Layer w0.254: v1(151.14,94.89) 151.14,121.45 142.85,129.74 57.04,129.74 U11.11
PB13: length 134.5
  Top Layer w0.254: v1(150.64,95.76) U1.74
  Bottom Layer w0.254: v1(150.64,95.76) 150.64,120.07 143.56,127.15 56.99,127.15 U11.13
PB14: length 132.1
  Top Layer w0.254: v1(150.14,97.08) U1.75
  Bottom Layer w0.254: U11.15 56.99,124.61 144.17,124.61 150.14,118.64 v1(150.14,97.08)
PB15: length 129.9
  Top Layer w0.254: v1(149.64,98.04) U1.76
  Bottom Layer w0.254: v1(149.64,98.04) 149.64,117.21 144.58,122.27 57.19,122.27 U11.17
PC0: length 118.1
  Top Layer w0.254: v1(123.29,33.17) 130.4,33.17 131.37,34.14 131.37,41.96 134.98,45.57 148.39,45.57 149,46.18 149,57.81 146.14,60.66 U1.26
  Bottom Layer w0.254: U10.17 58.29,33.17 v1(123.29,33.17)
PC1: length 117.5
  Top Layer w0.254: v1(119.18,40.54) 120.29,41.66 v1(130.2,41.66) ; v1(151.18,51.76) 151.18,43.84 149,41.66 v1(137.26,41.66) ; U1.27 146.64,61.03 148.12,59.55 v1(148.29,59.55)
  Bottom Layer w0.254: v1(137.26,41.66) v1(130.2,41.66) ; v1(148.29,59.55) 149.47,59.55 151.18,57.84 v1(151.18,51.76) ; U10.19 114.37,35.73 v1(119.18,40.54)
PC2: length 117.6
  Top Layer w0.254: v1(115.47,38.3) 119.53,38.3 122.07,40.84 v1(130.2,40.84) ; v1(137.26,40.84) 149.25,40.84 151.79,43.38 v1(151.79,52.17) ; U1.28 147.14,61.04 148.1,60.08 v1(148.64,60.08)
  Bottom Layer w0.254: v1(137.26,40.84) v1(130.2,40.84) ; v1(115.47,38.3) 58.3,38.3 U10.21 ; v1(151.79,52.17) 151.79,58.22 149.93,60.08 v1(148.64,60.08)
PC3: length 121.6
  Top Layer w0.254: v1(112.98,40.79) 113.94,39.83 113.94,38.05 114.76,37.24 119.69,37.24 122.48,40.03 v1(130.25,40.03) ; U1.29 147.64,61.12 148.18,60.58 v1(148.27,60.58) ; v1(152.4,51.76) 152.4,42.88 149.56,40.03 v1(137.21,40.03)
  Bottom Layer w0.254: v1(152.4,51.76) 152.4,58.42 150.24,60.58 v1(148.27,60.58) ; v1(137.21,40.03) v1(130.25,40.03) ; v1(112.98,40.79) 112.96,40.81 U10.23
PC4: length 110.3
  Top Layer w0.254: v1(148.39,68.72) 148.4,68.73 150.77,68.73 151.6,67.9 U1.44 155.77,67.9 v1(157.18,66.5)
  Bottom Layer w0.254: v1(148.39,68.72) 138.77,68.72 113.4,43.35 U10.25
PC5: length 109.4
  Top Layer w0.254: v1(157.18,67.26) 156.03,68.4 U1.45 151.71,68.4 150.88,69.24 148.97,69.24 v1(148.95,69.21)
  Bottom Layer w0.254: v1(148.95,69.21) 138.2,69.21 114.86,45.87 58.29,45.87 U10.27
PC9: length 103.1
  Top Layer w0.254: U1.99 138.14,81.65 v1(138.12,81.64)
  Bottom Layer w0.254: v1(138.12,81.64) 138.12,72.03 131.98,65.89 127.71,65.89 125.37,63.55 125.37,60.86 114,49.48 61.57,49.48 60.52,48.43 U10.29
PC10: length 101.8
  Top Layer w0.254: v1(95,80.31) 95.58,80.9 U1.111 ; v1(92.71,50.8) 92.76,50.85 v1(92.76,57.1)
  Bottom Layer w0.254: v1(95,80.31) 92.76,78.08 v1(92.76,57.1) ; v1(92.71,50.8) 58.44,50.8 U10.31
PC11: length 98.5
  Top Layer w0.254: v1(95.45,79.86) 96,80.4 U1.112 ; v1(93.47,57.1) v1(93.47,54.05)
  Bottom Layer w0.254: v1(95.45,79.86) 93.42,77.83 93.42,57.15 v1(93.47,57.1) ; U10.33 92.93,53.51 v1(93.47,54.05)
PC12: length 94.7
  Top Layer w0.254: v1(94.13,58.01) 93.78,57.66 91.29,57.66 89.68,56.05 U10.35 ; U1.113 96.46,79.9 v1(95.91,79.35)
  Bottom Layer w0.254: v1(95.91,79.35) 94.13,77.57 v1(94.13,58.01)
PC13: length 83.7
  Top Layer w0.254: U1.7 136.64,58.97 134.11,56.44 v1(114.05,56.44) ; U10.37 61.3,58.59 v1(62.48,57.4)
  Bottom Layer w0.254: v1(114.05,56.44) 63.45,56.44 v1(62.48,57.4)
PC14-OSC32_IN(PC14): length 88.3
  Top Layer w0.254: v1(114.81,55.63) 134.21,55.63 137.14,58.56 U1.8
  Bottom Layer w0.254: v1(114.81,55.63) 62.18,55.63 61.62,56.19 61.62,59.84 60.33,61.13 U10.39
PC15-OSC32_OUT(PC15): length 92
  Top Layer w0.254: v1(114.1,54.97) 134.67,54.97 137.64,57.94 U1.9
  Bottom Layer w0.254: U10.40 57.02,59.84 59.69,59.84 60.3,59.23 60.3,56.08 61.42,54.97 v1(114.1,54.97)
PD0: length 132.4
  Top Layer w0.254: v1(96.37,78.89) 96.88,79.4 U1.114 ; U10.8 56.98,21.74 94.03,21.74 94.89,22.61 v1(94.89,57.15)
  Bottom Layer w0.254: v1(94.89,57.15) 94.89,77.42 v1(96.37,78.89)
PD1: length 129.4
  Top Layer w0.254: U1.115 97.29,78.9 v1(96.82,78.44) ; v1(95.66,25.4) 95.66,57.1 v1(95.61,57.15)
  Bottom Layer w0.254: v1(96.82,78.44) 95.61,77.22 v1(95.61,57.15) ; v1(95.66,25.4) 94.59,24.33 57.03,24.33 U10.10
PD2: length 126.3
  Top Layer w0.254: v1(96.27,28.19) v1(96.27,57.15) ; v1(97.38,78.13) 97.66,78.4 U1.116
  Bottom Layer w0.254: v1(97.38,78.13) 96.27,77.01 v1(96.27,57.15) ; U10.12 56.98,26.82 94.89,26.82 v1(96.27,28.19)
PD3: length 124
  Top Layer w0.254: v1(97.66,77.6) 97.97,77.9 U1.117 ; v1(96.93,29.82) 96.93,56.9 v1(97.03,57)
  Bottom Layer w0.254: U10.14 56.98,29.36 96.47,29.36 v1(96.93,29.82) ; v1(97.66,77.6) 97.03,76.96 v1(97.03,57)
PD4: length 121.3
  Top Layer w0.254: U1.118 98.38,77.4 v1(98.15,77.17) ; v1(97.74,32.31) v1(97.74,57.33)
  Bottom Layer w0.254: v1(97.74,57.33) 97.74,76.76 v1(98.15,77.17) ; U10.16 56.98,31.9 97.33,31.9 v1(97.74,32.31)
PD5: length 118.4
  Top Layer w0.254: U1.119 98.85,76.9 v1(98.6,76.66) ; v1(98.6,57.1) v1(98.6,34.9)
  Bottom Layer w0.254: v1(98.6,34.9) 98.15,34.44 56.98,34.44 U10.18 ; v1(98.6,76.66) v1(98.6,57.1)
PD6: length 114.4
  Top Layer w0.254: v1(100.43,57.1) 100.43,37.74 v1(99.87,37.19) ; U1.122 129.18,75.4 129.18,75.4 128.78,75.4 128.78,75.4 100.39,75.4 v1(100.37,75.38)
  Bottom Layer w0.254: v1(100.37,75.38) 100.37,57.16 v1(100.43,57.1) ; v1(99.87,37.19) 57.19,37.19 U10.20
PD7: length 111.6
  Top Layer w0.254: v1(99.31,39.57) 99.78,40.04 v1(99.78,57.1) ; v1(99.78,74.99) 99.78,74.92 99.8,74.9 U1.123
  Bottom Layer w0.254: v1(99.78,74.99) v1(99.78,57.1) ; U10.22 57.03,39.57 v1(99.31,39.57)
PDR_ON: length 156.8
  Top Layer w0.254: U1.143 58.54,64.9 51.82,71.63 v1(51.82,103.38)
  Bottom Layer w0.254: U11.2 57,139.86 57,135.43 56.24,134.67 52.68,134.67 51.82,133.81 v1(51.82,103.38)
PE7: length 129.4
  Top Layer w0.254: v1(135.97,74.89) 135.98,74.9 U1.58
  Bottom Layer w0.254: U11.29 51.66,101.5 51.66,90.07 56.13,85.6 100.03,85.6 101.04,84.58 101.04,79.15 106.78,73.41 130.14,73.41 131.62,74.89 v1(135.97,74.89)
PE8: length 125.4
  Top Layer w0.254: U1.59 135.09,75.4 v1(135.08,75.39)
  Bottom Layer w0.254: v1(135.08,75.39) 131.27,75.39 129.9,74.02 107.19,74.02 102.01,79.2 102.01,85.24 100.74,86.51 56.64,86.51 52.53,90.63 52.53,99.83 U11.31
PE9: length 121
  Top Layer w0.254: v1(135.99,75.95) 136.04,75.9 U1.60
  Bottom Layer w0.254: U11.33 53.29,98.05 53.29,91.34 57.3,87.33 101.35,87.33 103.07,85.6 103.07,79.45 107.75,74.78 129.69,74.78 130.86,75.95 v1(135.99,75.95)
PE10: length 115.6
  Top Layer w0.254: v1(135.59,77.41) 135.6,77.4 U1.63
  Bottom Layer w0.254: U11.35 54,96.22 54,91.64 57.71,87.94 103.28,87.94 105.05,86.16 105.05,80.16 107.81,77.41 v1(135.59,77.41)
PE11: length 112.4
  Top Layer w0.254: v1(135.13,77.89) 135.14,77.9 U1.64
  Bottom Layer w0.254: v1(135.13,77.89) 108.7,77.89 106.68,79.91 106.68,86.77 104.14,89.31 57.3,89.31 54.51,92.1 54.51,94.19 U11.37
PE12: length 108.2
  Top Layer w0.254: v1(135.59,78.42) 135.61,78.4 U1.65
  Bottom Layer w0.254: U11.39 57.92,90.68 105.31,90.68 107.95,88.04 107.95,79.91 109.44,78.42 v1(135.59,78.42)
PE13: length 107
  Top Layer w0.254: U1.66 v1(135.13,78.9)
  Bottom Layer w0.254: v1(135.13,78.9) 110.38,78.9 109.22,80.06 109.22,90.83 107.18,92.87 U11.40
PE14: length 109.5
  Top Layer w0.254: U1.67 v1(135.64,79.4)
  Bottom Layer w0.254: U11.38 109.11,95.41 110.69,93.83 110.69,80.26 111.56,79.4 v1(135.64,79.4)
PE15: length 111.7
  Top Layer w0.254: U1.68 153.19,79.9 v1(135.13,79.9)
  Bottom Layer w0.254: U11.36 80.92,97.95 80.92,97.94 110.29,97.94 111.81,96.42 111.81,80.62 112.53,79.9 v1(135.13,79.9)
PF0: length 45.2
  Top Layer w0.254: v1(138.16,61.06) 138.14,61.08 U1.10
  Bottom Layer w0.254: v1(138.16,61.06) 138.16,46.12 U12.1
PF1: length 44.4
  Top Layer w0.254: U1.11 v1(138.64,60.55)
  Bottom Layer w0.254: v1(138.64,60.55) 138.64,49.18 U12.2
PF2: length 43.9
  Top Layer w0.254: v1(139.17,60.2) 139.14,60.23 U1.12
  Bottom Layer w0.254: v1(139.17,60.2) 139.17,51.69 162.29,28.56 U12.3
PF3: length 44.3
  Top Layer w0.254: v1(139.65,59.82) 139.65,62.34 U1.13
  Bottom Layer w0.254: v1(139.65,59.82) 139.65,52.83 160.27,32.21 162.92,32.21 164.88,30.24 164.88,30.02
PF4: length 44.8
  Top Layer w0.254: U1.14 v1(140.14,59.44)
  Bottom Layer w0.254: v1(140.14,59.44) 140.14,53.46 160.22,33.38 165.06,33.38 U12.5
PF5: length 47.8
  Top Layer w0.254: v1(147.93,49.89) 142.19,49.89 139.6,52.48 139.6,58.22 140.64,59.26 U1.15
  Bottom Layer w0.254: U12.6 169.04,32.94 152.09,49.89 v1(147.93,49.89)
PF6: length 50.1
  Top Layer w0.254: v1(148.28,51.1) 142.14,51.1 140.41,52.83 140.41,57.71 142.14,59.44 U1.18 v1(142.14,63.81)
  Bottom Layer w0.254: U12.7 171.12,34.41 154.43,51.1 v1(148.28,51.1)
PF7: length 47.1
  Top Layer w0.254: U1.19 142.65,62.36 v1(142.65,64.31)
  Bottom Layer w0.254: v1(142.65,64.31) 142.65,63.25 143.26,62.64 144.93,62.64 145.11,62.46 145.11,61.62 145.57,61.16 150.77,61.16 169.82,42.11 169.82,39.23 U12.8
PF8: length 48.1
  Top Layer w0.254: U1.20 v1(143.14,64.82)
  Bottom Layer w0.254: v1(143.14,64.82) 143.14,63.61 143.4,63.36 145.28,63.36 145.75,62.89 145.75,61.98 146,61.72 152.3,61.72 171.96,42.06 171.96,40.63 U12.9
PF9: length 46.4
  Top Layer w0.254: U1.21 v1(143.64,64.06)
  Bottom Layer w0.254: v1(143.64,64.06) 145.64,64.06 146.41,63.3 146.41,62.53 146.66,62.28 153.85,62.28 U12.10
PF10: length 48.1
  Top Layer w0.254: v1(144.17,64.72) 144.14,64.69 U1.22
  Bottom Layer w0.254: U12.11 156.77,62.89 147.37,62.89 147.12,63.14 147.12,63.6 146,64.72 v1(144.17,64.72)
PF11: length 44.2
  Top Layer w0.254: U1.49 159.52,70.4 v1(160.05,69.88)
  Bottom Layer w0.254: U12.12 179.07,44.13 179.07,50.85 v1(160.05,69.88)
PF12: length 44.5
  Top Layer w0.254: v1(160.68,70.41) 160.19,70.9 U1.50
  Bottom Layer w0.254: v1(160.68,70.41) 181,50.09 181,45.74 183.61,43.13
PF13: length 45.3
  Top Layer w0.254: U1.53 160.06,72.4 v1(161.39,71.07)
  Bottom Layer w0.254: U12.14 182.47,47.8 182.47,49.99 v1(161.39,71.07)
PF14: length 45.7
  Top Layer w0.254: U1.54 160.93,72.9 v1(162.1,71.73)
  Bottom Layer w0.254: U12.15 162.1,71.71 v1(162.1,71.73)
PF15: length 47.4
  Top Layer w0.254: U1.55 162.31,73.4 v1(163.12,72.59)
  Bottom Layer w0.254: v1(163.12,72.59) 185.01,50.7 186.65,50.7 U12.16
PG0: length 156.5
  Top Layer w0.254: v1(72.8,84.58) 71.53,85.85 71.53,132.28 70.16,133.66 62.23,133.66 61.16,134.72 57.76,134.72 57.05,135.43 57.05,137.37 U11.4 ; U1.56 v1(135.99,73.9)
  Bottom Layer w0.254: v1(135.99,73.9) 132.27,73.9 130.5,72.14 105.66,72.14 99.31,78.49 99.31,82.91 98.6,83.62 73.76,83.62 v1(72.8,84.58)
PG1: length 152.1
  Top Layer w0.254: U1.57 v1(135.07,74.4) ; v1(74.42,84.73) 72.69,86.46 72.69,133.35 70.97,135.08 62.64,135.08 61.66,136.05 U11.6
  Bottom Layer w0.254: v1(74.42,84.73) 74.73,84.43 99.16,84.43 100.03,83.57 100.03,78.79 106.07,72.75 130.32,72.75 131.98,74.4 v1(135.07,74.4)
PG2: length 128.1
  Top Layer w0.254: v1(143.66,121.51) 131.67,133.5 v1(77.93,133.5) ; U1.87 v1(144.14,85.24)
  Bottom Layer w0.254: v1(77.93,133.5) 77.92,133.51 U11.8 ; v1(144.14,85.24) 144.14,121.03 v1(143.66,121.51)
PG3: length 124.6
  Top Layer w0.254: v1(141.48,119.74) 141.48,119.79 130.3,130.96 v1(77.88,130.96) ; U1.88 v1(143.64,85.6)
  Bottom Layer w0.254: v1(143.64,85.6) 143.64,117.57 v1(141.48,119.74) ; v1(77.88,130.96) 58.28,130.96 U11.10
PG4: length 121.2
  Top Layer w0.254: v1(139.7,117.86) 129.03,128.52 v1(77.93,128.52) ; U1.89 143.15,83.96 v1(143.15,85.24)
  Bottom Layer w0.254: v1(77.93,128.52) 58.36,128.52 U11.12 ; v1(143.15,85.24) 143.15,114.4 v1(139.7,117.86)
PG5: length 118.1
  Top Layer w0.254: U1.90 v1(142.64,85.6) ; v1(77.93,125.88) 128.63,125.88 v1(138.12,116.38)
  Bottom Layer w0.254: v1(138.12,116.38) 142.64,111.87 v1(142.64,85.6) ; v1(77.93,125.88) 77.92,125.89 U11.14
PG6: length 115.2
  Top Layer w0.254: U1.91 142.14,85.24 v1(142.14,85.24) ; v1(136.85,114.91) 128.42,123.34 v1(77.93,123.34)
  Bottom Layer w0.254: v1(142.14,85.24) 142.14,109.63 v1(136.85,114.91) ; U11.16 77.92,123.35 v1(77.93,123.34)
PG7: length 112.4
  Top Layer w0.254: U1.92 v1(141.64,85.6)
  Bottom Layer w0.254: U11.18 58.28,120.8 128.27,120.8 141.68,107.39 141.68,85.64 v1(141.64,85.6)
PG8: length 109.6
  Top Layer w0.254: U1.93 v1(141.14,85.24)
  Bottom Layer w0.254: U11.20 58.28,118.26 128.12,118.26 141.14,105.24 v1(141.14,85.24)
PG9: length 106.4
  Top Layer w0.254: U11.22 67.4,115.73 70.26,112.88 70.26,85.6 72.8,83.06 91.03,83.06 99.69,74.4 U1.124
PG10: length 104.7
  Top Layer w0.254: U11.24 66.49,113.19 68.94,110.74 68.94,84.99 71.78,82.14 90.68,82.14 98.92,73.9 U1.125
PG11: length 103.7
  Top Layer w0.254: U1.126 98.05,73.4 90.17,81.28 70.51,81.28 67.82,83.97 67.82,109.47 66.64,110.65 U11.26
PG12: length 101.8
  Top Layer w0.254: U11.28 58.28,108.1 65.58,108.1 67,106.68 67,82.91 69.55,80.37 89.51,80.37 96.97,72.9 U1.127
PG13: length 99.8
  Top Layer w0.254: U11.30 58.28,105.56 64.41,105.56 65.28,104.7 65.28,83.01 68.83,79.45 89.1,79.45 96.15,72.4 U1.128
PG14: length 97.6
  Top Layer w0.254: U11.32 63.09,103.03 64.06,102.06 64.06,82.7 68.07,78.69 88.59,78.69 95.38,71.9 U1.129
PG15: length 96.2
  Top Layer w0.254: U11.34 62.07,100.49 62.89,99.67 62.89,81.89 67.06,77.72 87.78,77.72 95.1,70.4 128.68,70.4 128.68,70.4 129.08,70.4 129.08,70.4 U1.132
PLASM_OUT: length 42.8
  Top Layer w1.2: C52.1 45.87,79.73 47.07,78.53 47.07,60.39 44.68,58.01 33.3,58.01 32.58,58.72 R15.1
  vias: v1(17.57,15.16) v1(17.57,13.82) v1(18.59,127) v1(18.66,15.16) v1(18.67,13.82) v1(19.41,126.19) v1(19.72,15.16) v1(19.71,13.82) v1(19.91,128.17) v1(20.32,125.17) v1(20.7,127.25) v1(20.69,16.36) v1(20.69,15.17) v1(20.74,13.81) v1(21.23,129.18) v1(21.28,124.21) v1(21.64,126.29) v1(21.66,16.36) v1(21.67,15.17) v1(21.67,13.81) v1(22.05,128.32) v1(22.25,130.05) v1(22.3,123.19) v1(22.4,125.37) v1(22.59,16.36) v1(22.61,15.19) v1(22.61,13.81) v1(22.86,127.1) v1(23.11,129.08) v1(23.37,124.36) v1(23.37,122.17) v1(23.88,126.19) v1(24.13,128.12) v1(24.33,123.24) v1(24.74,125.27) v1(24.99,127.1) v1(25.55,124.31) v1(25.81,126.29) v1(26.57,125.32)
RESET: length 24.2
  Top Layer w0.254: U1.25 145.64,63.65 146.05,64.06 v1(147.47,64.06) ; C42.2 164.86,58.71 SW1.1 R12.1 161.91,60.91 v1(160.88,60.91)
  Bottom Layer w0.254: v1(160.88,60.91) 160.43,60.91 157.78,63.55 148.74,63.55 148.23,64.06 v1(147.47,64.06)
RX_C: length 120.8
  Top Layer w0.254: CN5.3 71.38,141.54 72.14,142.29 74.88,142.29 75.54,141.63 75.54,98.45 arc(78.1,92.27) 84.28,89.71 135.84,89.71 arc(136.76,89.33) 137.14,88.41 137.14,83.93
RX_GPS: length 83
  Top Layer w0.254: 139.64,83.93 139.64,91.29 arc(138.84,93.23) 136.91,94.03 96.82,94.03 arc(95.28,94.67) 94.64,96.22 94.64,117.15 arc(92.73,119.06) 90.81,117.15 H3.4
RX_HC14: length 70.9
  Top Layer w0.254: P1.4 71.83,75.44 arc(71.99,75.83) 72.39,76 80.31,76 arc(80.96,75.73) 81.23,75.08 81.23,67.26 arc(81.77,65.95) 83.09,65.4 U1.142
RX_TOF: length 54.8
  Top Layer w0.254: 151.14,62.33 151.14,63.41 151.49,63.75 184.96,63.75 arc(191.26,65.41) 196.6,69.14 arc(197.61,70.56) 198.12,72.24 arc(198.14,72.88) 198.02,73.51 arc(197.44,74.17) 196.56,74.17
SWCLK: length 14.3
  Top Layer w0.254: 131.58,81.89 120.14,81.89 119.35,82.68 H2.3
SWDIO: length 16.2
  Top Layer w0.254: H2.2 121.89,82.93 122.38,82.45 134.93,82.45 135.14,82.67 135.14,83.93
TX_C: length 115
  Top Layer w0.254: 136.64,83.93 136.64,87.59 arc(136.39,88.19) 135.79,88.44 82.96,88.44 arc(76.54,91.1) 73.88,97.52 CN5.4
TX_GPS: length 76.4
  Top Layer w0.254: 139.14,83.93 139.14,90.22 arc(138.5,91.76) 136.96,92.41 95.35,92.41 arc(93.94,92.99) 93.35,94.4 H3.3
TX_HC14: length 74.4
  Top Layer w0.254: P1.3 69.29,75.74 arc(69.6,76.5) 70.36,76.81 81.03,76.81 arc(81.92,76.44) 82.3,75.54 82.3,67.36 arc(82.72,66.33) 83.75,65.9 U1.141
TX_TOF: length 47.9
  Top Layer w0.254: 196.56,73.17 194.31,73.17 arc(192.21,72.21) 191.16,70.16 arc(188.92,66.02) 184.52,64.38 184.48,64.42 153.23,64.42 153.19,64.38
$1N1342: length 9.6
  Top Layer w0.254: 144.64,62.33 144.64,60.26 144.18,59.8 R1.2 143.98,59.59 C1.1 144.81,56.94 144.81,54.71 143.83,53.74 143.83,53.73
$1N1938: length 5.1
  Top Layer w0.254: H1.2 135.43,16.97 R3.2
$1N3661: length 5.1
  Top Layer w0.254: R2.2 132.84,17 H1.1
$1N5258: length 2.6
  Top Layer w0.6: C26.1 173.32,100.43 U2.1
$1N11253: length 8.6
  Top Layer w0.254: R11.1 124.66,67.77 125.02,67.41 131.58,67.41 U1.138
$1N11810: length 7.3
  Top Layer w0.254: 146.03,55.43 145.88,55.58 C2.1 145.88,59.59 R1.1 145.14,60.33 145.14,62.33
$1N11862: length 1.9
  Top Layer w0.5: R13.2 167.72,110.26 165.88,110.26
$1N14606: length 3.1
  Top Layer w0.5: U9.1 36.88,67.45 36.74,67.3
$1N14818: length 3.4
  Top Layer w0.6: U9.7 38.15,77.89 37.01,79.04 C49.1
$1N15032: length 2.3
  Top Layer w0.6: U9.4 42.93,70.34 C56.2
$1N15135: length 6.5
  Top Layer w0.6: C54.2 40.11,67 39.42,67.68 U9.3
$1N15320: length 13.1
  Top Layer w0.5: U9.2 38.17,70.32 R16.2
  Top Layer w1: R15.2 35.59,63.19 R16.2 ; C55.2 35.54,61.17 35.54,63.13
$1N18281: length 11.1
  Top Layer w2: SW2.2 173.66,77.98 174.7,76.95 CN4.2
$1N18286: length 10
  Top Layer w1.6: SW2.1 174.63,82.68 175.02,83.07 175.02,84.77
$1N24306: length 2.7
  Top Layer w0.254: 153.19,81.38 155.86,81.38 C57.1
$1N24342: length 2.1
  Top Layer w0.254: 134.64,83.93 134.64,85.99 134.62,86.02
$1N25576: length 8.8
  Top Layer w0.254: 19.33,134.65 22.51,134.65 R17.1 22.83,134.5 24.38,132.94 24.38,132.38 24.89,131.88 U13.4
$1N25775: length 9.9
  Top Layer w0.254: 18.57,20.09 21.78,20.09 R18.1 22.93,20.1 23.98,19.05 23.98,17.98 24.79,17.17 U14.4

## Copper pours and planes (outline as drawn; the poured copper is in the pictures)
+5V on Top Layer: 161.91,108.25 173.21,108.25 173.21,104.06 161.91,104.06
AGND on Top Layer: 139.5,22.35 144.98,22.35 144.98,15.9 139.5,15.9
AGND on Bottom Layer: 150.47,67.98 151.74,67.98 151.74,64.25 150.47,64.25
GND on Top Layer: 57.35,160.88 215.65,160.88 215.65,-5.13 57.35,-5.13
GND on Bottom Layer: 57.2,160.73 215.49,160.73 215.49,-5.28 57.2,-5.28
VCC on Top Layer: 171.3,93.39 181.41,93.39 181.41,86.03 171.3,86.03
BAT_GND on Top Layer: 2.13,142.27 6.81,147.12 24.23,147.12 29.06,142.29 29.06,127.15 45.87,110.34 45.87,100.38 49.58,96.67 49.58,60.76 29.36,40.54 29.36,9.45 24.28,4.37 6.4,4.37 2.13,8.64
BAT_GND on Bottom Layer: 2.13,142.27 6.81,147.07 24.23,147.07 29.06,142.24 29.06,127.1 45.87,110.29 45.87,100.33 49.58,96.62 49.58,60.71 29.36,40.49 29.36,9.4 24.28,4.32 6.4,4.32 2.13,8.59
BAT_IN+ on Top Layer: 1.47,109.74 37.23,109.74 37.23,34.14 1.47,34.14
PLASM_OUT on Top Layer: 17.78,133.66 46.91,133.66 46.91,81.48 17.78,81.48
PLASM_OUT on Top Layer: 16.86,19.05 23.04,19.05 23.04,13.16 16.86,13.16
PLASM_OUT on Bottom Layer: 16.86,133.86 27.69,133.86 27.69,13.16 16.86,13.16
VOUT1 on Top Layer: 6.66,135.99 15.14,135.99 15.14,130.23 6.66,130.23
VOUT2 on Top Layer: 6.15,21.79 14.38,21.79 14.38,15.85 6.15,15.85
$1N5263 on Top Layer: 172.96,107.74 179.18,107.74 179.18,91.49 172.96,91.49
$1N6361 on Top Layer: 166.61,100.5 169.91,100.5 169.91,97.2 166.61,97.2
$1N14805 on Top Layer: 36.2,85.34 41.22,85.34 41.22,75.38 36.2,75.38

Small or netless copper shapes (teardrops, artwork), in the pictures only: 294 on Top Layer, 193 on Bottom Layer

## Text on the board
Top Silkscreen Layer: 5V | GND | TX | RX | 3V3 | PPS | CLK | DO | GPS | 无线串口 | 超声波 | 下载 | 水质
